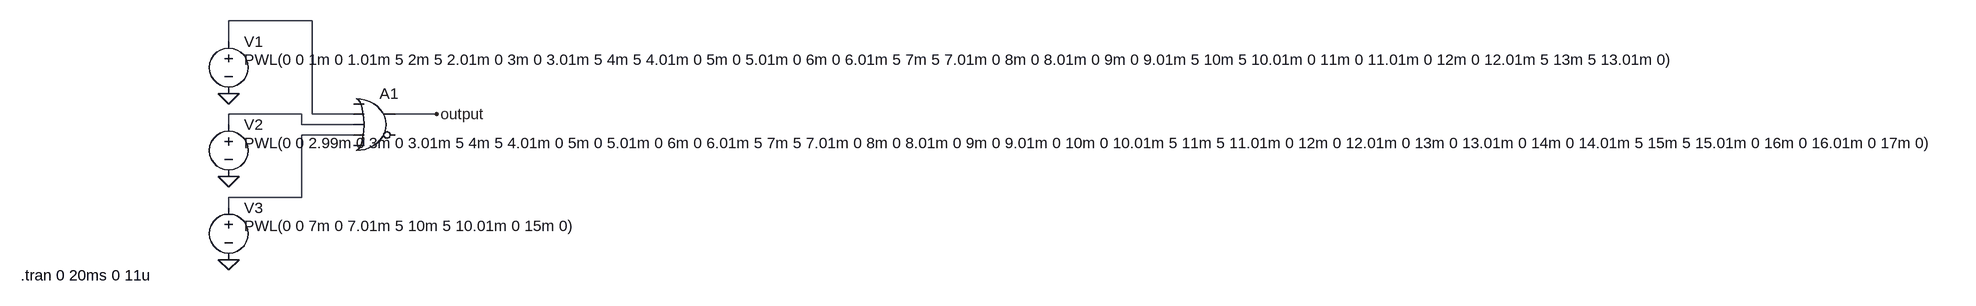
[diagram p0: schematic 3input_OR.asc]
3input_OR.asc, the LTspice schematic file:
Version 4.1
SHEET 1 3612 680
WIRE 112 0 -16 0
WIRE -16 32 -16 0
WIRE 96 144 -16 144
WIRE 112 144 112 0
WIRE 176 144 112 144
WIRE 304 144 240 144
WIRE -16 160 -16 144
WIRE 96 160 96 144
WIRE 176 160 96 160
WIRE 176 176 96 176
WIRE 96 272 96 176
WIRE 96 272 -16 272
WIRE -16 288 -16 272
FLAG -16 112 0
FLAG -16 240 0
FLAG -16 368 0
FLAG 304 144 output
SYMBOL Digital\\or 208 96 R0
SYMATTR InstName A1
SYMBOL voltage -16 16 R0
WINDOW 3 24 44 Left 2
WINDOW 123 0 0 Left 0
WINDOW 39 0 0 Left 0
SYMATTR Value PWL(0 0 1m 0 1.01m 5 2m 5 2.01m 0 3m 0 3.01m 5 4m 5 4.01m 0 5m 0 5.01m 0 6m 0 6.01m 5 7m 5 7.01m 0 8m 0 8.01m 0 9m 0 9.01m 5 10m 5 10.01m 0 11m 0 11.01m 0 12m 0 12.01m 5 13m 5 13.01m 0)
SYMATTR InstName V1
SYMBOL voltage -16 144 R0
WINDOW 3 24 44 Left 2
WINDOW 123 0 0 Left 0
WINDOW 39 0 0 Left 0
SYMATTR Value PWL(0 0 2.99m 0 3m 0 3.01m 5 4m 5 4.01m 0 5m 0 5.01m 0 6m 0 6.01m 5 7m 5 7.01m 0 8m 0 8.01m 0 9m 0 9.01m 0 10m 0 10.01m 5 11m 5 11.01m 0 12m 0 12.01m 0 13m 0 13.01m 0 14m 0 14.01m 5 15m 5 15.01m 0 16m 0 16.01m 0 17m 0)
SYMATTR InstName V2
SYMBOL voltage -16 272 R0
WINDOW 3 24 44 Left 2
WINDOW 123 0 0 Left 0
WINDOW 39 0 0 Left 0
SYMATTR Value PWL(0 0 7m 0 7.01m 5 10m 5 10.01m 0 15m 0)
SYMATTR InstName V3
TEXT -336 392 Left 2 !.tran 0 20ms 0 11u

The netlist it stands for:
* 3input_OR.asc
A1 0 N001 N002 N003 0 0 output 0 OR
V1 N001 0 PWL(0 0 1m 0 1.01m 5 2m 5 2.01m 0 3m 0 3.01m 5 4m 5 4.01m 0 5m 0 5.01m 0 6m 0 6.01m 5 7m 5 7.01m 0 8m 0 8.01m 0 9m 0 9.01m 5 10m 5 10.01m 0 11m 0 11.01m 0 12m 0 12.01m 5 13m 5 13.01m 0)
V2 N002 0 PWL(0 0 2.99m 0 3m 0 3.01m 5 4m 5 4.01m 0 5m 0 5.01m 0 6m 0 6.01m 5 7m 5 7.01m 0 8m 0 8.01m 0 9m 0 9.01m 0 10m 0 10.01m 5 11m 5 11.01m 0 12m 0 12.01m 0 13m 0 13.01m 0 14m 0 14.01m 5 15m 5 15.01m 0 16m 0 16.01m 0 17m 0)
V3 N003 0 PWL(0 0 7m 0 7.01m 5 10m 5 10.01m 0 15m 0)
.tran 0 20ms 0 11u
.backanno
.end